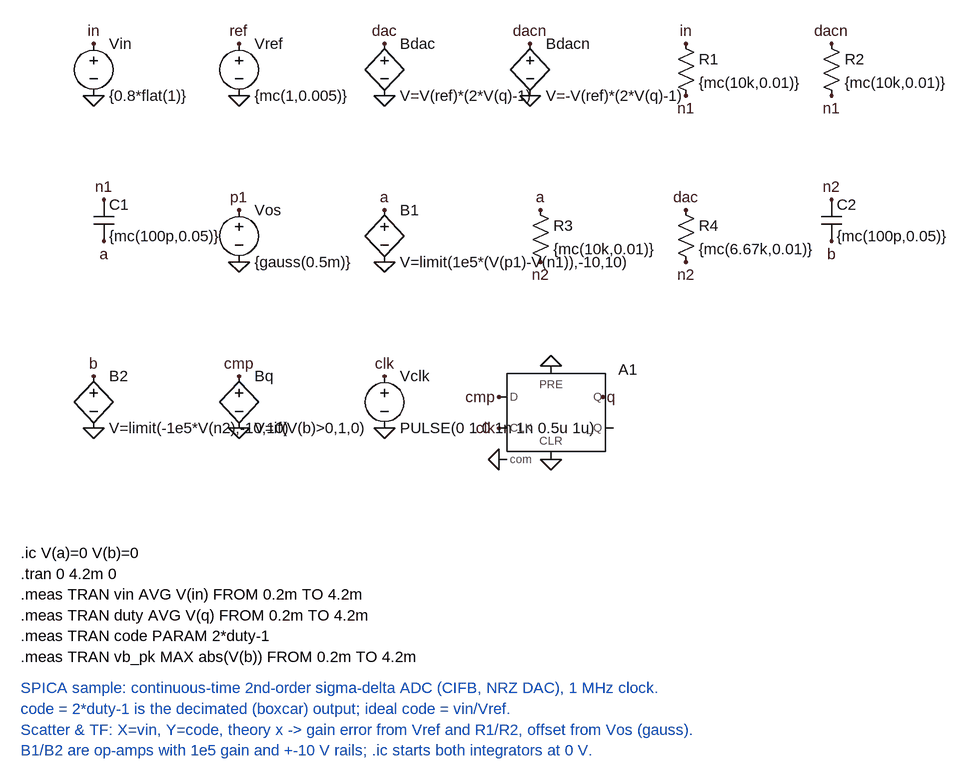
[diagram p0: schematic sigma_delta.asc]
sigma_delta.asc, the LTspice schematic file:
Version 4
SHEET 1 1600 1200
FLAG 144 80 in
FLAG 144 160 0
FLAG 368 80 ref
FLAG 368 160 0
FLAG 592 80 dac
FLAG 592 160 0
FLAG 816 80 dacn
FLAG 816 160 0
FLAG 1056 80 in
FLAG 1056 160 n1
FLAG 1280 80 dacn
FLAG 1280 160 n1
FLAG 160 320 n1
FLAG 160 384 a
FLAG 368 336 p1
FLAG 368 416 0
FLAG 592 336 a
FLAG 592 416 0
FLAG 832 336 a
FLAG 832 416 n2
FLAG 1056 336 dac
FLAG 1056 416 n2
FLAG 1280 320 n2
FLAG 1280 384 b
FLAG 144 592 b
FLAG 144 672 0
FLAG 368 592 cmp
FLAG 368 672 0
FLAG 592 592 clk
FLAG 592 672 0
FLAG 768 624 cmp
FLAG 768 672 clk
FLAG 848 576 0
FLAG 848 720 0
FLAG 928 624 q
FLAG 768 720 0
SYMBOL voltage 144 64 R0
SYMATTR InstName Vin
SYMATTR Value {0.8*flat(1)}
SYMBOL voltage 368 64 R0
SYMATTR InstName Vref
SYMATTR Value {mc(1,0.005)}
SYMBOL bv 592 64 R0
SYMATTR InstName Bdac
SYMATTR Value V=V(ref)*(2*V(q)-1)
SYMBOL bv 816 64 R0
SYMATTR InstName Bdacn
SYMATTR Value V=-V(ref)*(2*V(q)-1)
SYMBOL res 1040 64 R0
SYMATTR InstName R1
SYMATTR Value {mc(10k,0.01)}
SYMBOL res 1264 64 R0
SYMATTR InstName R2
SYMATTR Value {mc(10k,0.01)}
SYMBOL cap 144 320 R0
SYMATTR InstName C1
SYMATTR Value {mc(100p,0.05)}
SYMBOL voltage 368 320 R0
SYMATTR InstName Vos
SYMATTR Value {gauss(0.5m)}
SYMBOL bv 592 320 R0
SYMATTR InstName B1
SYMATTR Value V=limit(1e5*(V(p1)-V(n1)),-10,10)
SYMBOL res 816 320 R0
SYMATTR InstName R3
SYMATTR Value {mc(10k,0.01)}
SYMBOL res 1040 320 R0
SYMATTR InstName R4
SYMATTR Value {mc(6.67k,0.01)}
SYMBOL cap 1264 320 R0
SYMATTR InstName C2
SYMATTR Value {mc(100p,0.05)}
SYMBOL bv 144 576 R0
SYMATTR InstName B2
SYMATTR Value V=limit(-1e5*V(n2),-10,10)
SYMBOL bv 368 576 R0
SYMATTR InstName Bq
SYMATTR Value V=if(V(b)>0,1,0)
SYMBOL voltage 592 576 R0
SYMATTR InstName Vclk
SYMATTR Value PULSE(0 1 0 1n 1n 0.5u 1u)
SYMBOL Digital\dflop 848 576 R0
SYMATTR InstName A1
TEXT 32 864 Left 2 !.ic V(a)=0 V(b)=0
TEXT 32 896 Left 2 !.tran 0 4.2m 0
TEXT 32 928 Left 2 !.meas TRAN vin AVG V(in) FROM 0.2m TO 4.2m
TEXT 32 960 Left 2 !.meas TRAN duty AVG V(q) FROM 0.2m TO 4.2m
TEXT 32 992 Left 2 !.meas TRAN code PARAM 2*duty-1
TEXT 32 1024 Left 2 !.meas TRAN vb_pk MAX abs(V(b)) FROM 0.2m TO 4.2m
TEXT 32 1072 Left 2 ;SPICA sample: continuous-time 2nd-order sigma-delta ADC (CIFB, NRZ DAC), 1 MHz clock.
TEXT 32 1104 Left 2 ;code = 2*duty-1 is the decimated (boxcar) output; ideal code = vin/Vref.
TEXT 32 1136 Left 2 ;Scatter & TF: X=vin, Y=code, theory x -> gain error from Vref and R1/R2, offset from Vos (gauss).
TEXT 32 1168 Left 2 ;B1/B2 are op-amps with 1e5 gain and +-10 V rails; .ic starts both integrators at 0 V.

The netlist it stands for:
* sigma_delta.asc
Vin in 0 {0.8*flat(1)}
Vref ref 0 {mc(1,0.005)}
Bdac dac 0 V=V(ref)*(2*V(q)-1)
Bdacn dacn 0 V=-V(ref)*(2*V(q)-1)
R1 in n1 {mc(10k,0.01)}
R2 dacn n1 {mc(10k,0.01)}
C1 n1 a {mc(100p,0.05)}
Vos p1 0 {gauss(0.5m)}
B1 a 0 V=limit(1e5*(V(p1)-V(n1)),-10,10)
R3 a n2 {mc(10k,0.01)}
R4 dac n2 {mc(6.67k,0.01)}
C2 n2 b {mc(100p,0.05)}
B2 b 0 V=limit(-1e5*V(n2),-10,10)
Bq cmp 0 V=if(V(b)>0,1,0)
Vclk clk 0 PULSE(0 1 0 1n 1n 0.5u 1u)
A1 cmp 0 clk 0 0 0 q 0 DFLOP
.ic V(a)=0 V(b)=0
.tran 0 4.2m 0
.meas TRAN vin AVG V(in) FROM 0.2m TO 4.2m
.meas TRAN duty AVG V(q) FROM 0.2m TO 4.2m
.meas TRAN code PARAM 2*duty-1
.meas TRAN vb_pk MAX abs(V(b)) FROM 0.2m TO 4.2m
* SPICA sample: continuous-time 2nd-order sigma-delta ADC (CIFB, NRZ DAC), 1 MHz clock.
* code = 2*duty-1 is the decimated (boxcar) output; ideal code = vin/Vref.
* Scatter & TF: X=vin, Y=code, theory x -> gain error from Vref and R1/R2, offset from Vos (gauss).
* B1/B2 are op-amps with 1e5 gain and +-10 V rails; .ic starts both integrators at 0 V.
.backanno
.end